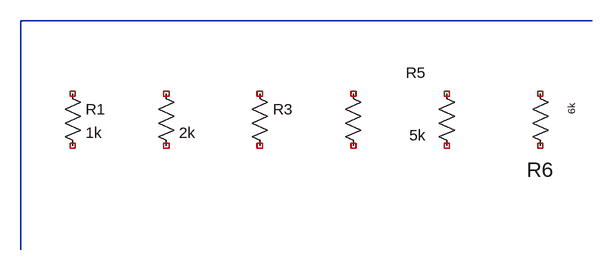
[diagram p0: schematic windows_hidden_moved.asc]
windows_hidden_moved.asc, the LTspice schematic file:
Version 4
SHEET 1 880 360
WIRE -32 -64 848 -64
WIRE -32 -64 -32 288
SYMBOL res 32 32 R0
SYMATTR InstName R1
SYMATTR Value 1k
SYMBOL res 176 32 R0
WINDOW 0 0 0 Invisible 2
SYMATTR InstName R2
SYMATTR Value 2k
SYMBOL res 320 32 R0
WINDOW 3 0 0 Invisible 2
SYMATTR InstName R3
SYMATTR Value 3k
SYMBOL res 464 32 R0
WINDOW 0 0 0 Invisible 2
WINDOW 3 0 0 Invisible 2
SYMATTR InstName R4
SYMATTR Value 4k
SYMBOL res 608 32 R0
WINDOW 0 -16 -16 Right 2
WINDOW 3 -16 80 Right 2
SYMATTR InstName R5
SYMATTR Value 5k
SYMBOL res 752 32 R0
WINDOW 0 16 112 Top 3
WINDOW 3 64 48 VLeft 1
SYMATTR InstName R6
SYMATTR Value 6k

The netlist it stands for:
* windows_hidden_moved.asc
R1 NC_01 NC_02 1k
R2 NC_03 NC_04 2k
R3 NC_05 NC_06 3k
R4 NC_07 NC_08 4k
R5 NC_09 NC_10 5k
R6 NC_11 NC_12 6k
.backanno
.end